# Altium schematic sheet RS485.SchDoc
size A4; SheetNumber: 4; SheetTotal: 14
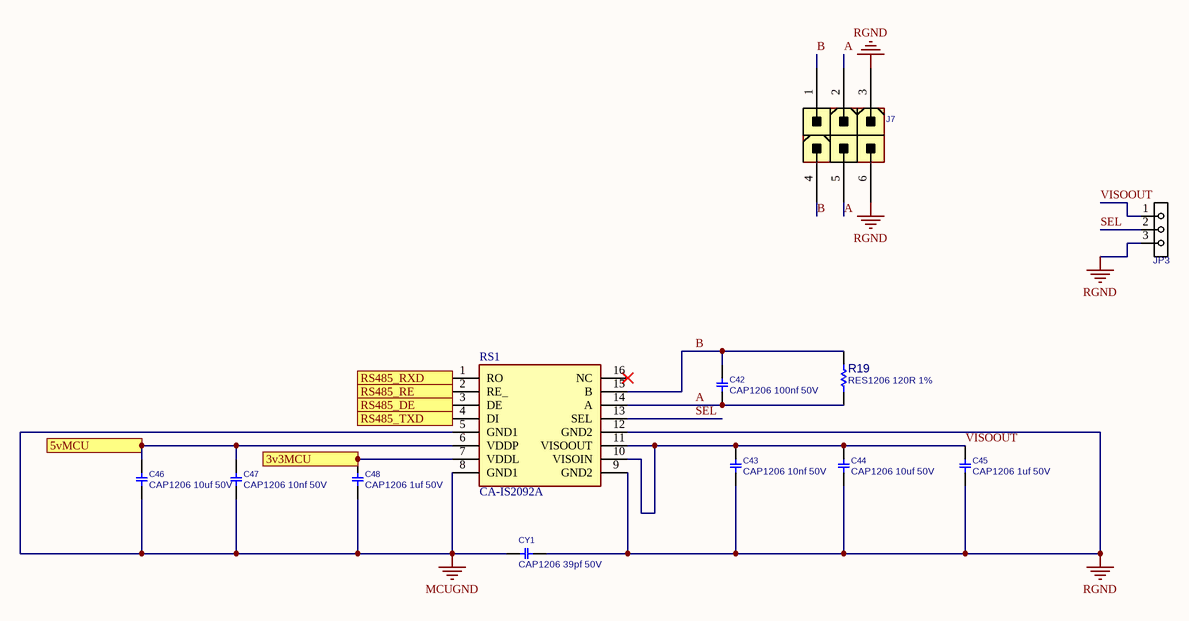
[diagram p0: RS485.SchDoc]

## Parts
C42  CAP1206 100nf 50V  [C1206]
C43  CAP1206 10nf 50V  [C1206]
C44  CAP1206 10uf 50V  [C1206]
C45  CAP1206 1uf 50V  [C1206]
C46  CAP1206 10uf 50V  [C1206]
C47  CAP1206 10nf 50V  [C1206]
C48  CAP1206 1uf 50V  [C1206]
CY1  CAP1206 39pf 50V  [C1206]
J7  CONN_ATXPWR_6  [ATXPWR_6]  (value not drawn)
JP3  JMPHDR3PIN  [JPH_3]  (value not drawn)
R19  RES1206 120R 1%  [R1206]
RS1  CA-IS2092A  [CAIS2062A]

## Ports
3v3MCU, 5vMCU, RS485_DE, RS485_RE, RS485_RXD, RS485_TXD

## Nets
MCUGND: C46.2 C47.2 C48.2 CY1.2 RS1.5(GND1) RS1.8(GND1)
RGND: C43.2 C44.2 C45.2 CY1.1 J7.3 J7.6 JP3.3 RS1.9(GND2) RS1.12(GND2)
3v3MCU: C48.1 RS1.7(VDDL) ; port 3v3MCU
5vMCU: C46.1 C47.1 RS1.6(VDDP) ; port 5vMCU
A: C42.2 J7.2 J7.5 R19.2 RS1.14(A)
B: C42.1 J7.1 J7.4 R19.1 RS1.15(B)
RS485_DE: RS1.3(DE) ; port RS485_DE
RS485_RE: RS1.2(RE_) ; port RS485_RE
RS485_RXD: RS1.1(RO) ; port RS485_RXD
RS485_TXD: RS1.4(DI) ; port RS485_TXD
SEL: JP3.2 RS1.13(SEL)
VISOOUT: C43.1 C44.1 C45.1 JP3.1 RS1.10(VISOIN) RS1.11(VISOOUT)

Not connected (* = marked no-connect by the designer): RS1 16(NC)*

## Library data of the parts
C42-C48 CY1 = CAP_SMD_MLCC_1206: CAP, MLCC; PARAM: -, -%; MANF_P#: MANF_PART#; PARAM2: -V; PRICE: 100= 1$; MANF: -; ASSEMBLY: ASSEMBLY
J7 = CONN_ATXPWR_6: CONN, ATX POWER, 6 P; MANF: TE; MANF_P#: 4-1775099-1; VALUE: CONN_ATXPWR_6; MountType: THD; PACKAGE: ATXPWR-6pin; Part Type: Conn.
JP3 = JUMPER_HDR_3P: JUMPER, HEADER 3PIN; MANF: MANF; MANF_P#: MANF_P#; VALUE: JMPHDR3PIN
R19 = RES_SMD_1206: RESISTOR, SMD; PARAM: 1%, 0.25W; DESC: DESCRIPTION; DIST#: MOUSER; MANF_P#: -; MANF: -; ASSEMBLY: ASSEMBLY; PRICE: -; PARAM2: -
RS1 = CA-IS2092A: LGA-16(4.7x5.2) Isolated RS485 Transceivers (with Power) ROHS; Manufacturer_Name: ChipAnalog; Geometry.Height: 1.09mm; Manufacturer_Part_Number: CA-IS2092A; Mouser Part Number: *; Mouser Price/Stock: *; Arrow Part Number: *; Arrow Price/Stock: *; Datasheet Link: https://e.chipanalog.com/Public/Uploads/uploadfile/files/20250325/CAIS2062AdatasheetVersion1.01en20250325.pdf